# Altium schematic sheet a0206-2006.9.SchDoc
size 558 x 431 mm
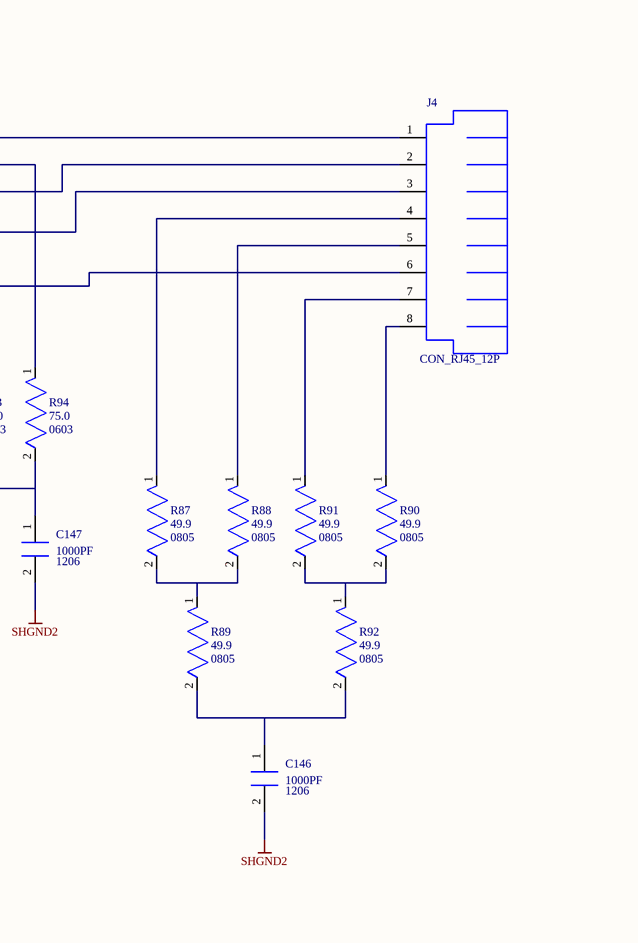
[diagram p0: a0206-2006.9.SchDoc, top right]
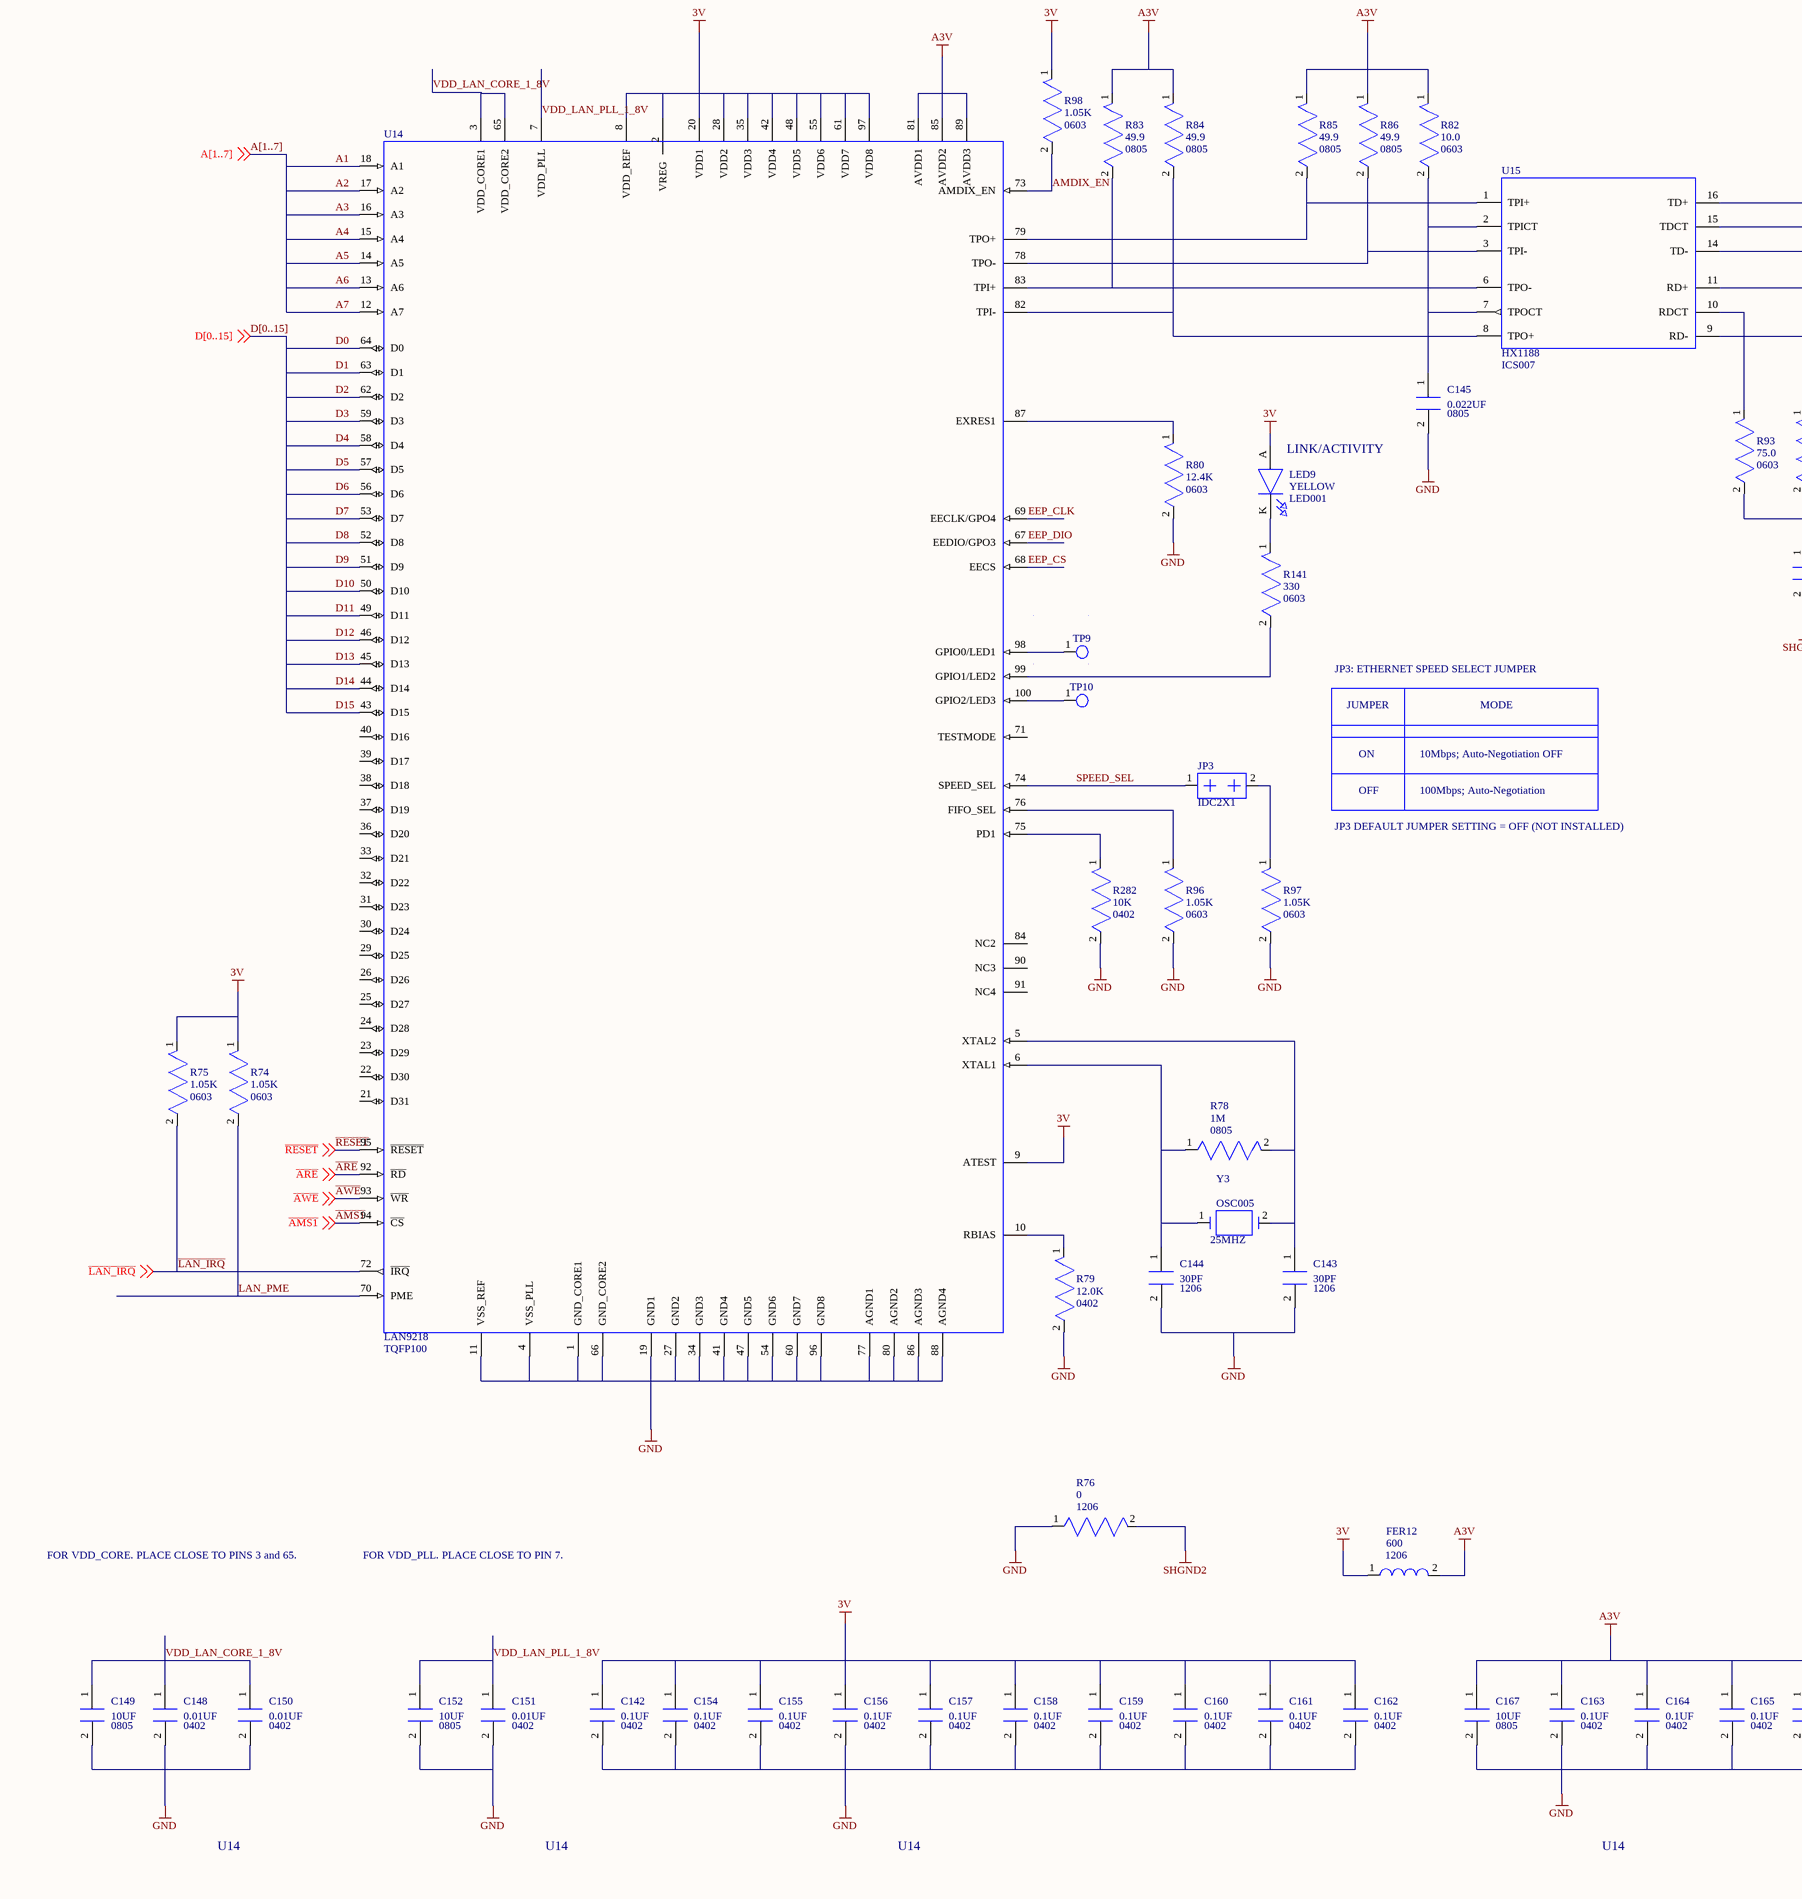
[diagram p1: a0206-2006.9.SchDoc, bottom left]
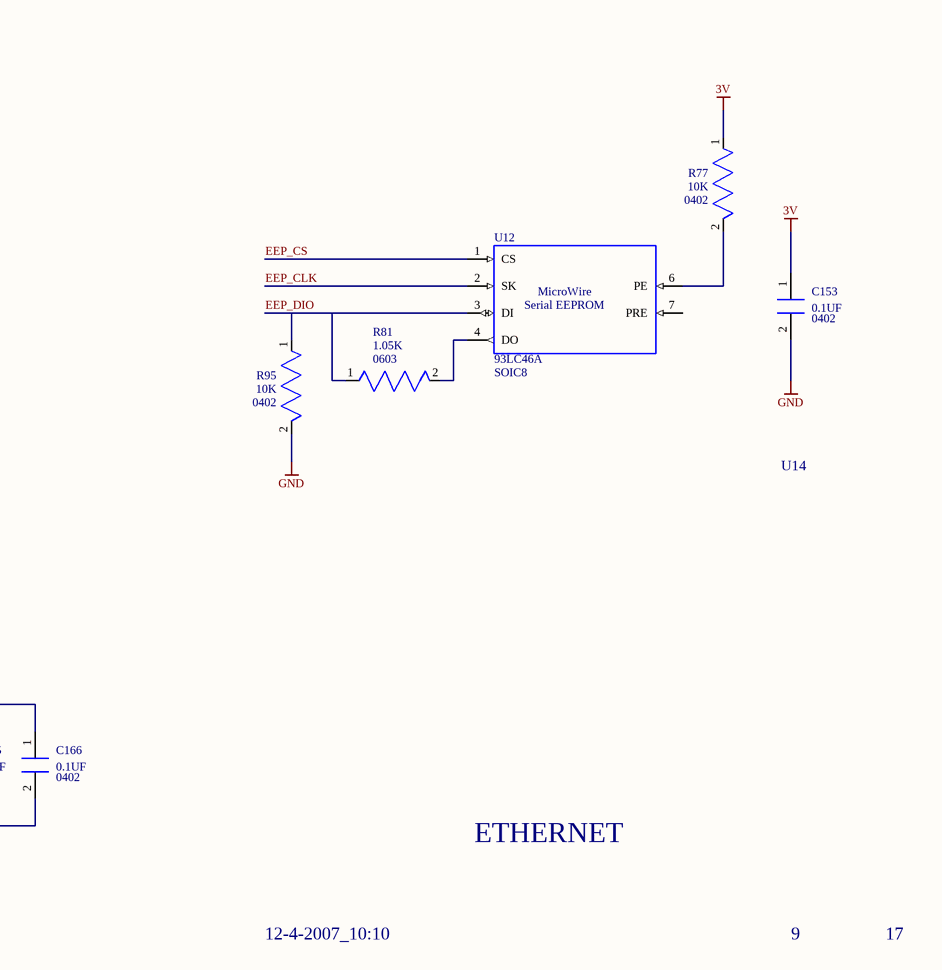
[diagram p2: a0206-2006.9.SchDoc, bottom right]

## Parts
C142  value 0.1UF  [0402]  (hidden comment: *)
C143  value 30PF  [1206]  (hidden comment: *)
C144  value 30PF  [1206]  (hidden comment: *)
C145  value 0.022UF  [0805]  (hidden comment: *)
C146  value 1000PF  [1206]  (hidden comment: *)
C147  value 1000PF  [1206]  (hidden comment: *)
C148  value 0.01UF  [0402]  (hidden comment: *)
C149  value 10UF  [0805]  (hidden comment: *)
C150  value 0.01UF  [0402]  (hidden comment: *)
C151  value 0.01UF  [0402]  (hidden comment: *)
C152  value 10UF  [0805]  (hidden comment: *)
C153  value 0.1UF  [0402]  (hidden comment: *)
C154  value 0.1UF  [0402]  (hidden comment: *)
C155  value 0.1UF  [0402]  (hidden comment: *)
C156  value 0.1UF  [0402]  (hidden comment: *)
C157  value 0.1UF  [0402]  (hidden comment: *)
C158  value 0.1UF  [0402]  (hidden comment: *)
C159  value 0.1UF  [0402]  (hidden comment: *)
C160  value 0.1UF  [0402]  (hidden comment: *)
C161  value 0.1UF  [0402]  (hidden comment: *)
C162  value 0.1UF  [0402]  (hidden comment: *)
C163  value 0.1UF  [0402]  (hidden comment: *)
C164  value 0.1UF  [0402]  (hidden comment: *)
C165  value 0.1UF  [0402]  (hidden comment: *)
C166  value 0.1UF  [0402]  (hidden comment: *)
C167  value 10UF  [0805]  (hidden comment: *)
FER12  value 600  [1206]  (hidden comment: *)
J4  *  [CON_RJ45_12P]  (value not drawn)
JP3  *  [IDC2X1]  (value not drawn)
LED9  value YELLOW  [LED001]  (hidden comment: *)
R74  value 1.05K  [0603]  (hidden comment: *)
R75  value 1.05K  [0603]  (hidden comment: *)
R76  value 0  [1206]  (hidden comment: *)
R77  value 10K  [0402]  (hidden comment: *)
R78  value 1M  [0805]  (hidden comment: *)
R79  value 12.0K  [0402]  (hidden comment: *)
R80  value 12.4K  [0603]  (hidden comment: *)
R81  value 1.05K  [0603]  (hidden comment: *)
R82  value 10.0  [0603]  (hidden comment: *)
R83  value 49.9  [0805]  (hidden comment: *)
R84  value 49.9  [0805]  (hidden comment: *)
R85  value 49.9  [0805]  (hidden comment: *)
R86  value 49.9  [0805]  (hidden comment: *)
R87  value 49.9  [0805]  (hidden comment: *)
R88  value 49.9  [0805]  (hidden comment: *)
R89  value 49.9  [0805]  (hidden comment: *)
R90  value 49.9  [0805]  (hidden comment: *)
R91  value 49.9  [0805]  (hidden comment: *)
R92  value 49.9  [0805]  (hidden comment: *)
R93  value 75.0  [0603]  (hidden comment: *)
R94  value 75.0  [0603]  (hidden comment: *)
R95  value 10K  [0402]  (hidden comment: *)
R96  value 1.05K  [0603]  (hidden comment: *)
R97  value 1.05K  [0603]  (hidden comment: *)
R98  value 1.05K  [0603]  (hidden comment: *)
R141  value 330  [0603]  (hidden comment: *)
R282  value 10K  [0402]  (hidden comment: *)
TP9  *  [TP]  (value not drawn)
TP10  *  [TP]  (value not drawn)
U12  PART: 93LC46A  [SOIC8]  (hidden comment: *)
U14  PART: LAN9218  [TQFP100]  (hidden comment: *)
U15  PART: HX1188  [ICS007]  (hidden comment: *)
Y3  value 25MHZ  [OSC005]  (hidden comment: *)

## Nets
3V: C142.1(A) C153.1(A) C154.1(A) C155.1(A) C156.1(A) C157.1(A) C158.1(A) C159.1(A) C160.1(A) C161.1(A) C162.1(A) FER12.1(A) LED9.A(ANODE) R74.1(N1) R75.1(N1) R77.1(N1) R98.1(N1) U12.8(3V) U14.2(VREG) U14.8(VDD_REF) U14.9(ATEST) U14.20(VDD1) U14.28(VDD2) U14.35(VDD3) U14.42(VDD4) U14.48(VDD5) U14.55(VDD6) U14.61(VDD7) U14.97(VDD8)
A3V: C163.1(A) C164.1(A) C165.1(A) C166.1(A) C167.1(A) FER12.2(B) R82.1(N1) R83.1(N1) R84.1(N1) R85.1(N1) R86.1(N1) U14.81(AVDD1) U14.85(AVDD2) U14.89(AVDD3)
GND: C142.2(B) C143.2(B) C144.2(B) C145.2(B) C148.2(B) C149.2(B) C150.2(B) C151.2(B) C152.2(B) C153.2(B) C154.2(B) C155.2(B) C156.2(B) C157.2(B) C158.2(B) C159.2(B) C160.2(B) C161.2(B) C162.2(B) C163.2(B) C164.2(B) C165.2(B) C166.2(B) C167.2(B) R76.1(N1) R79.2(N2) R80.2(N2) R95.2(N2) R96.2(N2) R97.2(N2) R282.2(N2) U12.5(GND) U14.1(GND_CORE1) U14.4(VSS_PLL) U14.11(VSS_REF) U14.19(GND1) U14.27(GND2) U14.34(GND3) U14.41(GND4) U14.47(GND5) U14.54(GND6) U14.60(GND7) U14.66(GND_CORE2) U14.77(AGND1) U14.80(AGND2) U14.86(AGND3) U14.88(AGND4) U14.96(GND8)
SHGND2: C146.2(B) C147.2(B) J4.11(SHGND2) J4.12(SHGND2) R76.2(N2)
A1: U14.18(A1)
A2: U14.17(A2)
A3: U14.16(A3)
A4: U14.15(A4)
A5: U14.14(A5)
A6: U14.13(A6)
A7: U14.12(A7)
~{AMS1}: U14.94(~{CS}) ; off-sheet ~{AMS1}
~{ARE}: U14.92(~{RD}) ; off-sheet ~{ARE}
~{AWE}: U14.93(~{WR}) ; off-sheet ~{AWE}
AMDIX_EN: R98.2(N2) U14.73(AMDIX_EN)
D0: U14.64(D0)
D1: U14.63(D1)
D2: U14.62(D2)
D3: U14.59(D3)
D4: U14.58(D4)
D5: U14.57(D5)
D6: U14.56(D6)
D7: U14.53(D7)
D8: U14.52(D8)
D9: U14.51(D9)
D10: U14.50(D10)
D11: U14.49(D11)
D12: U14.46(D12)
D13: U14.45(D13)
D14: U14.44(D14)
D15: U14.43(D15)
EEP_CLK: U12.2(SK) U14.69(EECLK/GPO4)
EEP_CS: U12.1(CS) U14.68(EECS)
EEP_DIO: R81.1(N1) R95.1(N1) U12.3(DI) U14.67(EEDIO/GPO3)
~{LAN_IRQ}: R75.2(N2) U14.72(~{IRQ}) ; off-sheet ~{LAN_IRQ}
LAN_PME: R74.2(N2) U14.70(PME)
~{RESET}: U14.95(~{RESET}) ; off-sheet ~{RESET}
SPEED_SEL: JP3.1 U14.74(SPEED_SEL)
VDD_LAN_CORE_1_8V: C148.1(A) C149.1(A) C150.1(A) U14.3(VDD_CORE1) U14.65(VDD_CORE2)
VDD_LAN_PLL_1_8V: C151.1(A) C152.1(A) U14.7(VDD_PLL)
NetC143_1: C143.1(A) R78.2(N2) U14.5(XTAL2) Y3.2(N2)
NetC144_1: C144.1(A) R78.1(N1) U14.6(XTAL1) Y3.1(N1)
NetC145_1: C145.1(A) R82.2(N2) U15.2(TPICT) U15.7(TPOCT)
NetC146_1: C146.1(A) R89.2(N2) R92.2(N2)
NetC147_1: C147.1(A) R93.2(N2) R94.2(N2)
NetJ4_1: J4.1 U15.16(TD+)
NetJ4_2: J4.2 U15.14(TD-)
NetJ4_3: J4.3 U15.11(RD+)
NetJ4_4: J4.4 R87.1(N1)
NetJ4_5: J4.5 R88.1(N1)
NetJ4_6: J4.6 U15.9(RD-)
NetJ4_7: J4.7 R91.1(N1)
NetJ4_8: J4.8 R90.1(N1)
NetJP3_2: JP3.2 R97.1(N1)
NetLED9_K: LED9.K(CATHODE) R141.1(N1)
NetR77_2: R77.2(N2) U12.6(PE)
NetR79_1: R79.1(N1) U14.10(RBIAS)
NetR80_1: R80.1(N1) U14.87(EXRES1)
NetR81_2: R81.2(N2) U12.4(DO)
NetR83_2: R83.2(N2) U14.83(TPI+) U15.6(TPO-)
NetR84_2: R84.2(N2) U14.82(TPI-) U15.8(TPO+)
NetR85_2: R85.2(N2) U14.79(TPO+) U15.1(TPI+)
NetR86_2: R86.2(N2) U14.78(TPO-) U15.3(TPI-)
NetR87_2: R87.2(N2) R88.2(N2) R89.1(N1)
NetR90_2: R90.2(N2) R91.2(N2) R92.1(N1)
NetR93_1: R93.1(N1) U15.10(RDCT)
NetR94_1: R94.1(N1) U15.15(TDCT)
NetR96_1: R96.1(N1) U14.76(FIFO_SEL)
NetR141_2: R141.2(N2) U14.99(GPIO1/LED2)
NetR282_1: R282.1(N1) U14.75(PD1)
NetTP9_1: TP9.1(TP) U14.98(GPIO0/LED1)
NetTP10_1: TP10.1(TP) U14.100(GPIO2/LED3)

Not connected (* = marked no-connect by the designer): J4 9 10; U12 7(PRE); U14 21(D31) 22(D30) 23(D29) 24(D28) 25(D27) 26(D26) 29(D25) 30(D24) 31(D23) 32(D22) 33(D21) 36(D20) 37(D19) 38(D18) 39(D17) 40(D16) 71(TESTMODE) 84(NC2) 90(NC3) 91(NC4); U15 4 5 12 13

## Buses and harness runs
bus A[1..7]
bus D[0..15]

## Notes on the sheet
- (near LED9) LINK/ACTIVITY
- JP3: ETHERNET SPEED SELECT JUMPER
- JUMPER
- MODE
- OFF
- ON
- 10Mbps; Auto-Negotiation OFF
- 100Mbps; Auto-Negotiation
- JP3 DEFAULT JUMPER SETTING = OFF (NOT INSTALLED)
- U14
- FOR VDD_CORE. PLACE CLOSE TO PINS 3 and 65.
- FOR VDD_PLL. PLACE CLOSE TO PIN 7.
- ETHERNET
- 12-4-2007_10:10
- 9
- 17
- A
- B
- C
- D
- 1
- 2
- 3
- 20 Cotton Road
- 4
- DEVICES
- ANALOG
- Nashua, NH 03063
- PH: 1-800-ANALOGD
- Title
- ADSP-BF548 EZ-KIT LITE
- Size
- Board No.
- A0206-2006
- Rev
- 1.4B
- Date
- Sheet
- of
- (in symbol ICS_93CSXXL.1) MicroWire; Serial EEPROM

## Library data of the parts
C142 C155 C157 C159 C161 C163 C165 = CAP_NON_POLARIZED.2: PART_SPEC: CAPACITOR; LEVEL: STD; TYPE: X5R; PRT_NUM: 7000278; VOLTAGE: 10V; TOLERANCE: 10%; PKG_TYPE: 0402; ROHS: ROHS
C143 C144 = CAP_NON_POLARIZED.2: PART_SPEC: CAPACITOR; LEVEL: STD; TYPE: NPO; PRT_NUM: 7000150; VOLTAGE: 100V; TOLERANCE: 5%; PKG_TYPE: 1206; ROHS: ROHS
C145 = CAP_NON_POLARIZED.2: PART_SPEC: CAPACITOR; LEVEL: STD; PRT_NUM: 7000331; TYPE: X7R; VOLTAGE: 50V; TOLERANCE: 5%; PKG_TYPE: 0805; ROHS: ROHS
C146 = CAP_NON_POLARIZED.2: PART_SPEC: CAPACITOR; LEVEL: STD; PRT_NUM: 7000572; TOLERANCE: 10%; VOLTAGE: 2000V; TYPE: X7R LOW_ESR; PKG_TYPE: 1206; ROHS: ROHS
C147 = CAP_NON_POLARIZED.2: PART_SPEC: CAPACITOR; LEVEL: STD; PRT_NUM: 7000572; TYPE: X7R LOW_ESR; VOLTAGE: 2000V; TOLERANCE: 10%; PKG_TYPE: 1206; ROHS: ROHS
C148 = CAP_NON_POLARIZED.2: PART_SPEC: CAPACITOR; LEVEL: STD; PRT_NUM: 7000279; VOLTAGE: 16V; TOLERANCE: 10%; TYPE: X7R; PKG_TYPE: 0402; ROHS: ROHS
C149 = CAP_NON_POLARIZED.2: PART_SPEC: CAPACITOR; LEVEL: STD; TOLERANCE: 10%; VOLTAGE: 6.3V; PRT_NUM: 7000265; TYPE: X5R; PKG_TYPE: 0805; ROHS: ROHS
C150 C151 = CAP_NON_POLARIZED.2: PART_SPEC: CAPACITOR; LEVEL: STD; TYPE: X7R; TOLERANCE: 10%; VOLTAGE: 16V; PRT_NUM: 7000279; PKG_TYPE: 0402; ROHS: ROHS
C152 C167 = CAP_NON_POLARIZED.2: PART_SPEC: CAPACITOR; LEVEL: STD; TYPE: X5R; PRT_NUM: 7000265; VOLTAGE: 6.3V; TOLERANCE: 10%; PKG_TYPE: 0805; ROHS: ROHS
C153 = CAP_NON_POLARIZED.2: PART_SPEC: CAPACITOR; LEVEL: STD; PRT_NUM: 7000278; VOLTAGE: 10V; TOLERANCE: 10%; TYPE: X5R; PKG_TYPE: 0402; ROHS: ROHS
C154 C156 C158 C160 C162 C164 C166 = CAP_NON_POLARIZED.2: PART_SPEC: CAPACITOR; LEVEL: STD; TOLERANCE: 10%; VOLTAGE: 10V; PRT_NUM: 7000278; TYPE: X5R; PKG_TYPE: 0402; ROHS: ROHS
FER12 = FER_STANDARD.1: PART_SPEC: FERRITE; LEVEL: STD; FREQ: 100MHZ; PRT_NUM: 7000117; CURRENT: 500MA; PKG_TYPE: 1206; ROHS: ROHS
J4 = CON_RJ45_12P.1: RA; PART_SPEC: CONNECTOR; LEVEL: STD; NC: 9,10; CONFIGURATION: 8PIN; PRT_NUM: 6000830; PKG_TYPE: CON_RJ45_12P; ROHS: ROHS; TYPE: RJ45
JP3 = CON_2X1.2: HEADER; PART_SPEC: CONNECTOR; LEVEL: STD; PRT_NUM: 6000774; CONFIGURATION: 2X1; PKG_TYPE: IDC2X1; TYPE: IDC; ROHS: ROHS
LED9 = LED_STANDARD.3: GULL-WING; PART_SPEC: LED; LEVEL: STD; PD1: AMBER-SMT; PRT_NUM: 7000027; PKG_TYPE: LED001; ROHS: ROHS
R74 = RES_STANDARD.2: PART_SPEC: RESISTOR; LEVEL: STD; POWER: 1/16W; PRT_NUM: 7000458; TOLERANCE: 1%; PKG_TYPE: 0603; ROHS: ROHS
R75 R96 R98 = RES_STANDARD.2: PART_SPEC: RESISTOR; LEVEL: STD; POWER: 1/16W; TOLERANCE: 1%; PRT_NUM: 7000458; PKG_TYPE: 0603; ROHS: ROHS
R76 = RES_STANDARD.1: PART_SPEC: RESISTOR; LEVEL: STD; POWER: 1/4W; PRT_NUM: 7000021; TOLERANCE: 5%; PKG_TYPE: 1206; ROHS: ROHS
R77 = RES_STANDARD.2: PART_SPEC: RESISTOR; LEVEL: STD; POWER: 1/16W; TOLERANCE: 5%; PRT_NUM: 7000280; PKG_TYPE: 0402; ROHS: ROHS
R78 = RES_STANDARD.1: PART_SPEC: RESISTOR; LEVEL: STD; POWER: 1/10W; PRT_NUM: 7000046; TOLERANCE: 5%; PKG_TYPE: 0805; ROHS: ROHS
R79 = RES_STANDARD.2: PART_SPEC: RESISTOR; LEVEL: STD; PRT_NUM: 7000543; TOLERANCE: 1%; POWER: 1/16W; PKG_TYPE: 0402; ROHS: ROHS
R80 = RES_STANDARD.2: PART_SPEC: RESISTOR; LEVEL: STD; PRT_NUM: 7000410; POWER: 1/10W; TOLERANCE: 1%; PKG_TYPE: 0603; ROHS: ROHS
R81 = RES_STANDARD.1: PART_SPEC: RESISTOR; LEVEL: STD; TOLERANCE: 1%; PRT_NUM: 7000458; POWER: 1/16W; PKG_TYPE: 0603; ROHS: ROHS
R82 = RES_STANDARD.2: PART_SPEC: RESISTOR; LEVEL: STD; PRT_NUM: 7000580; POWER: 1/10W; TOLERANCE: 1%; PKG_TYPE: 0603; ROHS: ROHS
R83 R85 R87 R89 R90 = RES_STANDARD.2: PART_SPEC: RESISTOR; LEVEL: STD; TOLERANCE: 1%; PRT_NUM: 7000335; POWER: 1/10W; PKG_TYPE: 0805; ROHS: ROHS
R84 R86 R88 R91 R92 = RES_STANDARD.2: PART_SPEC: RESISTOR; LEVEL: STD; POWER: 1/10W; PRT_NUM: 7000335; TOLERANCE: 1%; PKG_TYPE: 0805; ROHS: ROHS
R93 = RES_STANDARD.2: PART_SPEC: RESISTOR; LEVEL: STD; PRT_NUM: 7000417; POWER: 1/10W; TOLERANCE: 1%; PKG_TYPE: 0603; ROHS: ROHS
R94 = RES_STANDARD.2: PART_SPEC: RESISTOR; LEVEL: STD; TOLERANCE: 1%; POWER: 1/10W; PRT_NUM: 7000417; PKG_TYPE: 0603; ROHS: ROHS
R95 = RES_STANDARD.2: PART_SPEC: RESISTOR; LEVEL: STD; PRT_NUM: 7000280; TOLERANCE: 5%; POWER: 1/16W; PKG_TYPE: 0402; ROHS: ROHS
R97 = RES_STANDARD.2: PART_SPEC: RESISTOR; LEVEL: STD; PRT_NUM: 7000458; TOLERANCE: 1%; POWER: 1/16W; PKG_TYPE: 0603; ROHS: ROHS
R141 = RES_STANDARD.2: PART_SPEC: RESISTOR; LEVEL: STD; POWER: 1/10W; PRT_NUM: 7000368; TOLERANCE: 5%; PKG_TYPE: 0603; ROHS: ROHS
R282 = RES_STANDARD.2: PART_SPEC: RESISTOR; LEVEL: STD; PRT_NUM: 7000280; POWER: 1/16W; TOLERANCE: 5%; PKG_TYPE: 0402; ROHS: ROHS
TP9 TP10 = MSC_TEST_POINT.2: TESTPOINT; CLASS: DNP; LEVEL: STD; PART_SPEC: TESTPOINT; PART: TESTPOINT; ROHS: ROHS; PKG_TYPE: TP
U12 = ICS_93CSXXL.1: 1K (128X8) SERIAL ROM; LEVEL: STD; PRT_NUM: 1000444; PKG_TYPE: SOIC8; WEB: http://ww1.microchip.com/downloads/en/DeviceDoc/21749F.pdf; ROHS: ROHS
U14 = ICS_LAN9218.1: 10/100 ETHERNET CONTROLLE; LEVEL: STD; PRT_NUM: 1000421; PKG_TYPE: TQFP100; ROHS: ROHS; WEB: http://www.smsc.com/main/catalog/lan9218.html
U15 = ICS_HX1188.1: MAGNETIC FOR ETHERNET; NC: 4,5,12,13; LEVEL: STD; PRT_NUM: 1000420; PKG_TYPE: ICS007; ROHS: ROHS; WEB: http://www.pulseeng.com/products/datasheets/H325.pdf
Y3 = OSC_CRYSTAL.1: CRYSTAL; LEVEL: STD; PD2: SMT; PRT_NUM: 1000139; PART_SPEC: CRYSTAL; PKG_TYPE: OSC005; ROHS: ROHS; VOLTAGE: SMT